# Altium schematic sheet Top-Sheet.SchDoc
size 420 x 297 mm; SheetNumber: 1; SheetTotal: 7
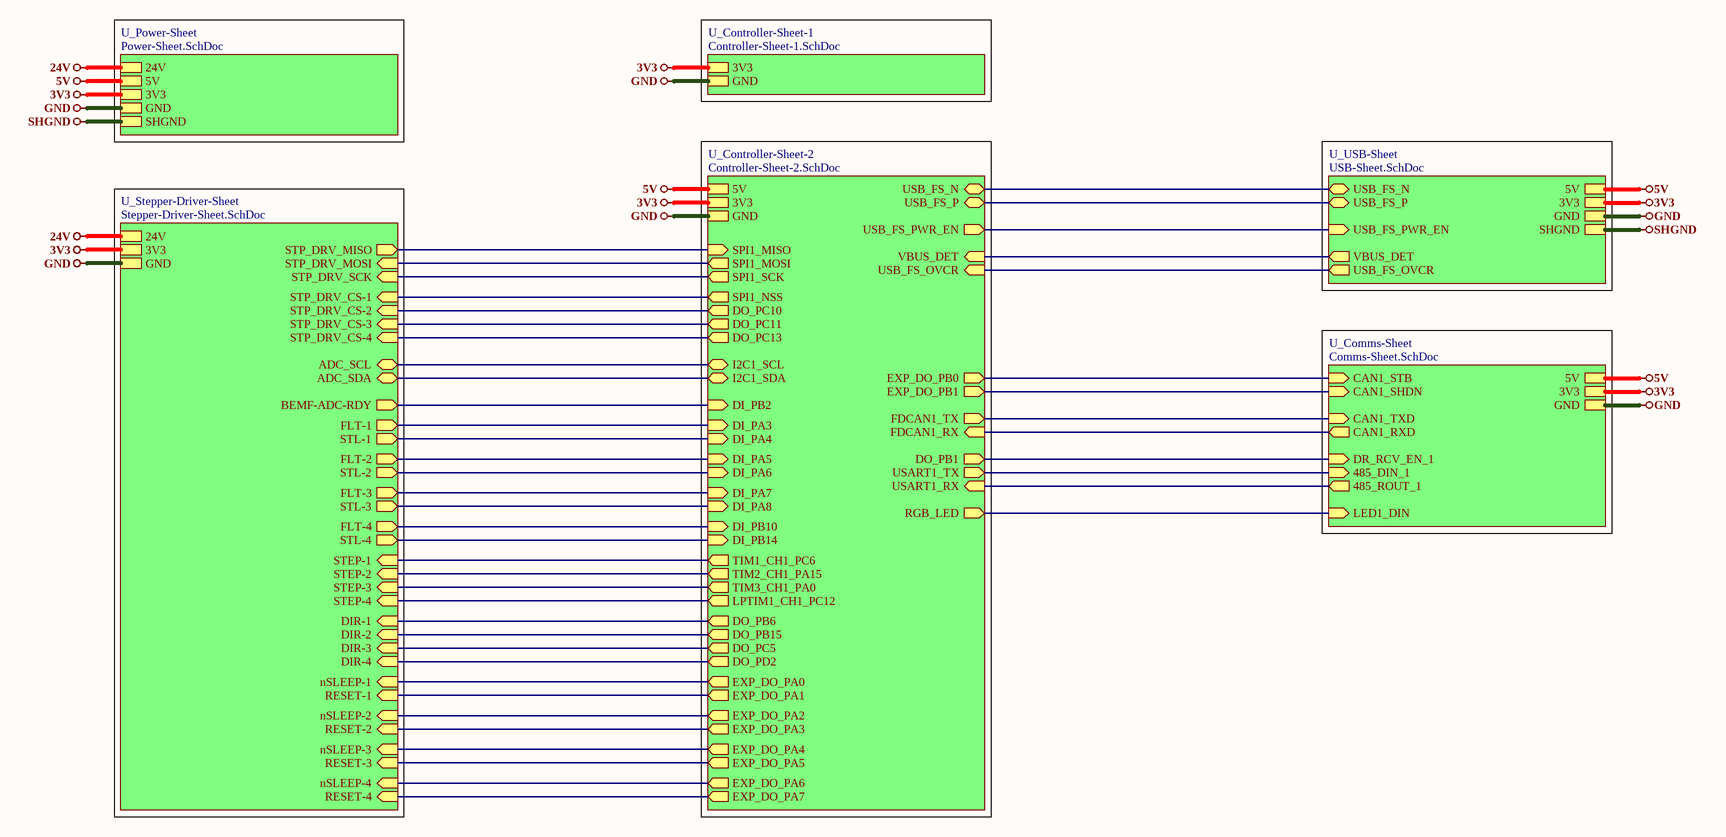
[diagram p0: Top-Sheet.SchDoc]

## Sub-sheets
U_Comms-Sheet = Comms-Sheet.SchDoc: CAN1_STB (in), CAN1_TXD (in), CAN1_RXD (out), CAN1_SHDN (in), LED1_DIN (in), DR_RCV_EN_1 (in), 485_ROUT_1 (out), 485_DIN_1 (in), GND, 3V3, 5V
U_Controller-Sheet-1 = Controller-Sheet-1.SchDoc: GND, 3V3
U_Controller-Sheet-2 = Controller-Sheet-2.SchDoc: FDCAN1_RX (in), FDCAN1_TX (out), USB_FS_N (bidir), USB_FS_P (bidir), USB_FS_OVCR (in), GND, 3V3, 5V, VBUS_DET (in), USB_FS_PWR_EN (out), TIM3_CH1_PA0 (out), TIM2_CH1_PA15 (out), TIM1_CH1_PC6 (out), LPTIM1_CH1_PC12 (out), SPI1_MOSI (out), SPI1_MISO (in), SPI1_NSS (out), SPI1_SCK (out), USART1_RX (in), USART1_TX (out), DI_PA3 (in), DI_PA4 (in), DI_PA5 (in), DI_PA6 (in), DI_PA7 (in), DI_PA8 (in), DI_PB2 (in), DI_PB10 (in), DI_PB14 (in), DO_PB6 (out), DO_PB15 (out), DO_PD2 (out), DO_PC5 (out), DO_PC10 (out), DO_PC11 (out), DO_PC13 (out), RGB_LED (out), I2C1_SCL (bidir), I2C1_SDA (bidir), EXP_DO_PA0 (out), EXP_DO_PA1 (out), EXP_DO_PA2 (out), EXP_DO_PA3 (out), EXP_DO_PA4 (out), EXP_DO_PA5 (out), EXP_DO_PA6 (out), EXP_DO_PA7 (out), EXP_DO_PB0 (out), EXP_DO_PB1 (out), DO_PB1 (out)
U_Power-Sheet = Power-Sheet.SchDoc: GND, 3V3, 5V, 24V, SHGND
U_Stepper-Driver-Sheet = Stepper-Driver-Sheet.SchDoc: BEMF-ADC-RDY (out), STP_DRV_SCK (in), STP_DRV_CS-1 (in), STP_DRV_MISO (out), STP_DRV_MOSI (in), STP_DRV_CS-2 (in), STP_DRV_CS-3 (in), STP_DRV_CS-4 (in), ADC_SCL (bidir), ADC_SDA (bidir), GND, 3V3, 24V, nSLEEP-1 (in), RESET-1 (in), STEP-1 (in), DIR-1 (in), FLT-1 (out), STL-1 (out), nSLEEP-2 (in), RESET-2 (in), STEP-2 (in), DIR-2 (in), FLT-2 (out), STL-2 (out), nSLEEP-3 (in), RESET-3 (in), STEP-3 (in), DIR-3 (in), FLT-3 (out), STL-3 (out), nSLEEP-4 (in), RESET-4 (in), STEP-4 (in), DIR-4 (in), FLT-4 (out), STL-4 (out)
U_USB-Sheet = USB-Sheet.SchDoc: USB_FS_N (bidir), USB_FS_P (bidir), VBUS_DET (out), USB_FS_PWR_EN (in), USB_FS_OVCR (out), GND, 3V3, 5V, SHGND

## Nets
3V3: sheet U_Controller-Sheet-2/3V3, sheet U_USB-Sheet/3V3, sheet U_Comms-Sheet/3V3, sheet U_Stepper-Driver-Sheet/3V3, sheet U_Power-Sheet/3V3, sheet U_Controller-Sheet-1/3V3
5V: sheet U_Controller-Sheet-2/5V, sheet U_USB-Sheet/5V, sheet U_Comms-Sheet/5V, sheet U_Power-Sheet/5V
24V: sheet U_Stepper-Driver-Sheet/24V, sheet U_Power-Sheet/24V
GND: sheet U_Controller-Sheet-2/GND, sheet U_USB-Sheet/GND, sheet U_Comms-Sheet/GND, sheet U_Stepper-Driver-Sheet/GND, sheet U_Power-Sheet/GND, sheet U_Controller-Sheet-1/GND
SHGND: sheet U_USB-Sheet/SHGND, sheet U_Power-Sheet/SHGND
(unnamed): sheet U_Controller-Sheet-2/FDCAN1_RX, sheet U_Comms-Sheet/CAN1_RXD
(unnamed): sheet U_Controller-Sheet-2/FDCAN1_TX, sheet U_Comms-Sheet/CAN1_TXD
(unnamed): sheet U_Controller-Sheet-2/USB_FS_N, sheet U_USB-Sheet/USB_FS_N
(unnamed): sheet U_Controller-Sheet-2/USB_FS_P, sheet U_USB-Sheet/USB_FS_P
(unnamed): sheet U_Controller-Sheet-2/USB_FS_OVCR, sheet U_USB-Sheet/USB_FS_OVCR
(unnamed): sheet U_Controller-Sheet-2/VBUS_DET, sheet U_USB-Sheet/VBUS_DET
(unnamed): sheet U_Controller-Sheet-2/USB_FS_PWR_EN, sheet U_USB-Sheet/USB_FS_PWR_EN
(unnamed): sheet U_Controller-Sheet-2/TIM3_CH1_PA0, sheet U_Stepper-Driver-Sheet/STEP-3
(unnamed): sheet U_Controller-Sheet-2/TIM2_CH1_PA15, sheet U_Stepper-Driver-Sheet/STEP-2
(unnamed): sheet U_Controller-Sheet-2/TIM1_CH1_PC6, sheet U_Stepper-Driver-Sheet/STEP-1
(unnamed): sheet U_Controller-Sheet-2/LPTIM1_CH1_PC12, sheet U_Stepper-Driver-Sheet/STEP-4
(unnamed): sheet U_Controller-Sheet-2/SPI1_MOSI, sheet U_Stepper-Driver-Sheet/STP_DRV_MOSI
(unnamed): sheet U_Controller-Sheet-2/SPI1_MISO, sheet U_Stepper-Driver-Sheet/STP_DRV_MISO
(unnamed): sheet U_Controller-Sheet-2/SPI1_NSS, sheet U_Stepper-Driver-Sheet/STP_DRV_CS-1
(unnamed): sheet U_Controller-Sheet-2/SPI1_SCK, sheet U_Stepper-Driver-Sheet/STP_DRV_SCK
(unnamed): sheet U_Controller-Sheet-2/USART1_RX, sheet U_Comms-Sheet/485_ROUT_1
(unnamed): sheet U_Controller-Sheet-2/USART1_TX, sheet U_Comms-Sheet/485_DIN_1
(unnamed): sheet U_Controller-Sheet-2/DI_PA3, sheet U_Stepper-Driver-Sheet/FLT-1
(unnamed): sheet U_Controller-Sheet-2/DI_PA4, sheet U_Stepper-Driver-Sheet/STL-1
(unnamed): sheet U_Controller-Sheet-2/DI_PA5, sheet U_Stepper-Driver-Sheet/FLT-2
(unnamed): sheet U_Controller-Sheet-2/DI_PA6, sheet U_Stepper-Driver-Sheet/STL-2
(unnamed): sheet U_Controller-Sheet-2/DI_PA7, sheet U_Stepper-Driver-Sheet/FLT-3
(unnamed): sheet U_Controller-Sheet-2/DI_PA8, sheet U_Stepper-Driver-Sheet/STL-3
(unnamed): sheet U_Controller-Sheet-2/DI_PB2, sheet U_Stepper-Driver-Sheet/BEMF-ADC-RDY
(unnamed): sheet U_Controller-Sheet-2/DI_PB10, sheet U_Stepper-Driver-Sheet/FLT-4
(unnamed): sheet U_Controller-Sheet-2/DI_PB14, sheet U_Stepper-Driver-Sheet/STL-4
(unnamed): sheet U_Controller-Sheet-2/DO_PB6, sheet U_Stepper-Driver-Sheet/DIR-1
(unnamed): sheet U_Controller-Sheet-2/DO_PB15, sheet U_Stepper-Driver-Sheet/DIR-2
(unnamed): sheet U_Controller-Sheet-2/DO_PD2, sheet U_Stepper-Driver-Sheet/DIR-4
(unnamed): sheet U_Controller-Sheet-2/DO_PC5, sheet U_Stepper-Driver-Sheet/DIR-3
(unnamed): sheet U_Controller-Sheet-2/DO_PC10, sheet U_Stepper-Driver-Sheet/STP_DRV_CS-2
(unnamed): sheet U_Controller-Sheet-2/DO_PC11, sheet U_Stepper-Driver-Sheet/STP_DRV_CS-3
(unnamed): sheet U_Controller-Sheet-2/DO_PC13, sheet U_Stepper-Driver-Sheet/STP_DRV_CS-4
(unnamed): sheet U_Controller-Sheet-2/RGB_LED, sheet U_Comms-Sheet/LED1_DIN
(unnamed): sheet U_Controller-Sheet-2/I2C1_SCL, sheet U_Stepper-Driver-Sheet/ADC_SCL
(unnamed): sheet U_Controller-Sheet-2/I2C1_SDA, sheet U_Stepper-Driver-Sheet/ADC_SDA
(unnamed): sheet U_Controller-Sheet-2/EXP_DO_PA0, sheet U_Stepper-Driver-Sheet/nSLEEP-1
(unnamed): sheet U_Controller-Sheet-2/EXP_DO_PA1, sheet U_Stepper-Driver-Sheet/RESET-1
(unnamed): sheet U_Controller-Sheet-2/EXP_DO_PA2, sheet U_Stepper-Driver-Sheet/nSLEEP-2
(unnamed): sheet U_Controller-Sheet-2/EXP_DO_PA3, sheet U_Stepper-Driver-Sheet/RESET-2
(unnamed): sheet U_Controller-Sheet-2/EXP_DO_PA4, sheet U_Stepper-Driver-Sheet/nSLEEP-3
(unnamed): sheet U_Controller-Sheet-2/EXP_DO_PA5, sheet U_Stepper-Driver-Sheet/RESET-3
(unnamed): sheet U_Controller-Sheet-2/EXP_DO_PA6, sheet U_Stepper-Driver-Sheet/nSLEEP-4
(unnamed): sheet U_Controller-Sheet-2/EXP_DO_PA7, sheet U_Stepper-Driver-Sheet/RESET-4
(unnamed): sheet U_Controller-Sheet-2/EXP_DO_PB0, sheet U_Comms-Sheet/CAN1_STB
(unnamed): sheet U_Controller-Sheet-2/EXP_DO_PB1, sheet U_Comms-Sheet/CAN1_SHDN
(unnamed): sheet U_Controller-Sheet-2/DO_PB1, sheet U_Comms-Sheet/DR_RCV_EN_1

## Notes on the sheet
- File:
- Title:
- Date:
- Page
- Num:
- Total:
- Drawn By: Huzaifa Ali